# Altium schematic sheet Sata.SchDoc: NVMe
size A3; Organization: Altium Limited; Address1: L3, 12a Rodborough Rd; Address2: Frenchs Forest; Address3: NSW; Address4: Australia 2086
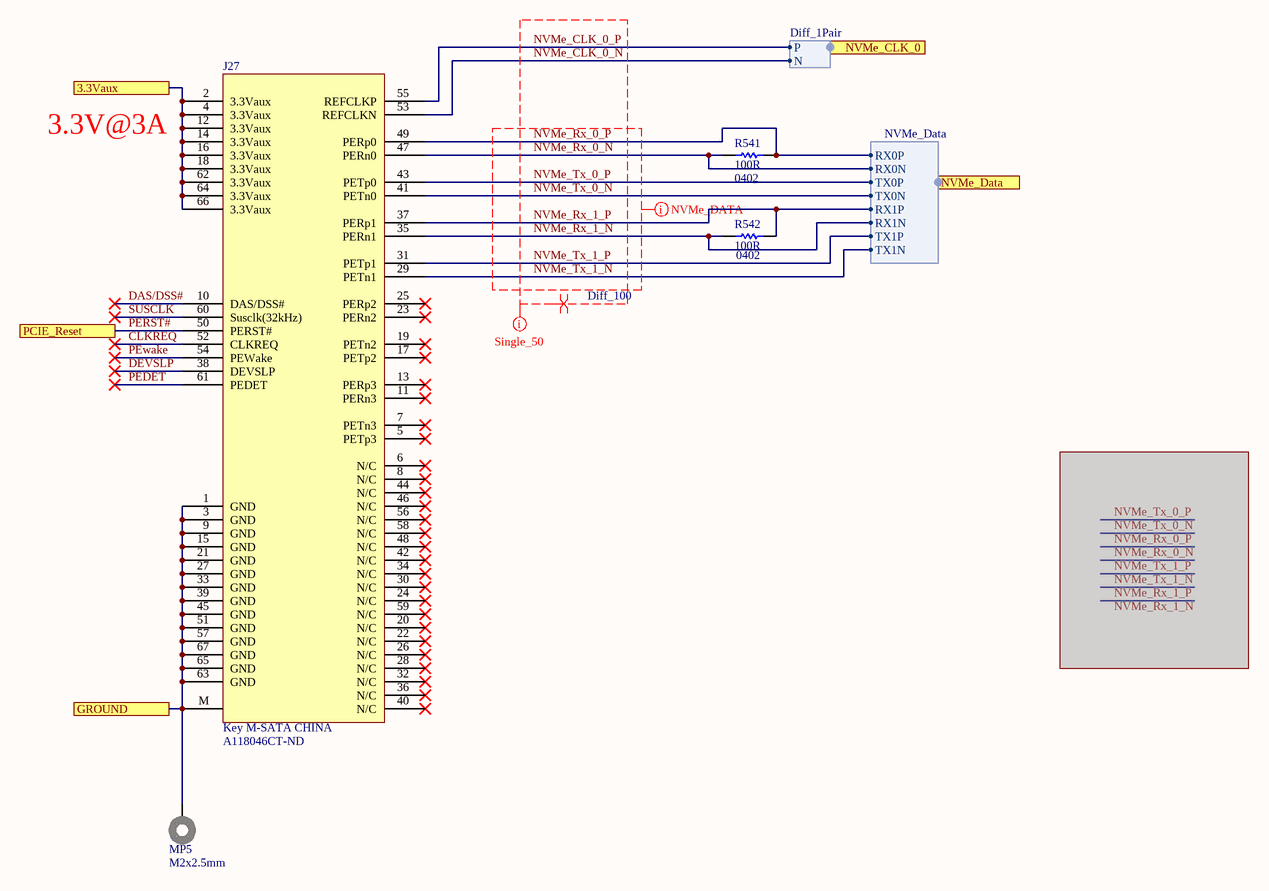
[diagram p0: Sata.SchDoc]

## Parts
J27  Key M-SATA CHINA  Supplier Part Number 1: A118046CT-ND  [M.2 KEY M - NVMe]
MP5  M2x2.5mm  [9774025243]
R541  100R  Case/Package: 0402  [RES 0402/1005 RF KK]
R542  100R  Case/Package: 0402  [RES 0402/1005 RF KK]

## Ports
3.3Vaux, GROUND, NVMe_CLK_0 (harness Diff_1Pair), NVMe_Data (harness NVMe_Data), PCIE_Reset

## Harnesses
Diff_1Pair: P, N
NVMe_Data: RX0P, RX0N, TX0P, TX0N, RX1P, RX1N, TX1P, TX1N

## Nets
3.3Vaux: J27.2(3.3Vaux) J27.4(3.3Vaux) J27.12(3.3Vaux) J27.14(3.3Vaux) J27.16(3.3Vaux) J27.18(3.3Vaux) J27.62(3.3Vaux) J27.64(3.3Vaux) J27.66(3.3Vaux) ; port 3.3Vaux
CLKREQ: J27.52(CLKREQ)
DAS/DSS#: J27.10(DAS/DSS#)
DEVSLP: J27.38(DEVSLP)
GROUND: J27.1(GND) J27.3(GND) J27.9(GND) J27.15(GND) J27.21(GND) J27.27(GND) J27.33(GND) J27.39(GND) J27.45(GND) J27.51(GND) J27.57(GND) J27.63(GND) J27.65(GND) J27.67(GND) J27.M MP5.1 ; port GROUND
NVMe_CLK_0_N: J27.53(REFCLKN) ; port NVMe_CLK_0.N
NVMe_CLK_0_P: J27.55(REFCLKP) ; port NVMe_CLK_0.P
NVMe_Rx_0_N: J27.47(PERn0) R541.2 ; port NVMe_Data.RX0N
NVMe_Rx_0_P: J27.49(PERp0) R541.1 ; port NVMe_Data.RX0P
NVMe_Rx_1_N: J27.35(PERn1) R542.1 ; port NVMe_Data.RX1N
NVMe_Rx_1_P: J27.37(PERp1) R542.2 ; port NVMe_Data.RX1P
NVMe_Tx_0_N: J27.41(PETn0) ; port NVMe_Data.TX0N
NVMe_Tx_0_P: J27.43(PETp0) ; port NVMe_Data.TX0P
NVMe_Tx_1_N: J27.29(PETn1) ; port NVMe_Data.TX1N
NVMe_Tx_1_P: J27.31(PETp1) ; port NVMe_Data.TX1P
PEDET: J27.61(PEDET)
PERST#: J27.50(PERST#) ; port PCIE_Reset
PEwake: J27.54(PEWake)
SUSCLK: J27.60(Susclk(32kHz))

Not connected (* = marked no-connect by the designer): J27 5(PETp3)* 6(N/C)* 7(PETn3)* 8(N/C)* 11(PERn3)* 13(PERp3)* 17(PETp2)* 19(PETn2)* 20(N/C)* 22(N/C)* 23(PERn2)* 24(N/C)* 25(PERp2)* 26(N/C)* 28(N/C)* 30(N/C)* 32(N/C)* 34(N/C)* 36(N/C)* 40(N/C)* 42(N/C)* 44(N/C)* 46(N/C)* 48(N/C)* 56(N/C)* 58(N/C)* 59(N/C)*

## Layout directives
net class NVMe_DATA: NVMe_Rx_0_N, NVMe_Rx_0_P, NVMe_Rx_1_N, NVMe_Rx_1_P, NVMe_Tx_0_N, NVMe_Tx_0_P, NVMe_Tx_1_N, NVMe_Tx_1_P
differential pair; differential pair class Diff_100: NVMe_CLK_0_N, NVMe_CLK_0_P, NVMe_Rx_0_N, NVMe_Rx_0_P, NVMe_Rx_1_N, NVMe_Rx_1_P, NVMe_Tx_0_N, NVMe_Tx_0_P, NVMe_Tx_1_N, NVMe_Tx_1_P
net class Single_50: NVMe_CLK_0_N, NVMe_CLK_0_P, NVMe_Rx_0_N, NVMe_Rx_0_P, NVMe_Rx_1_N, NVMe_Rx_1_P, NVMe_Tx_0_N, NVMe_Tx_0_P, NVMe_Tx_1_N, NVMe_Tx_1_P

## Notes on the sheet
- 3.3V@3A
- Title
- Size:
- Date:
- A3
- Number:
- Time:
- Revision:
- Sheet
- of
- File:

## Library data of the parts
J27 = 1-2199230-6_CHINA: CONN EDGE DUAL FMALE 67POS 0.020; Manufacturer 1: TE Connectivity; Number of Positions: 67; PCB Mounting Orientation: Right Angle; Contact Current Rating: 500mA; Pitch: 0.5mm; Supplier 1: Digi-Key; Manufacturer Part Number 1: 1-2199230-6; Stock 1: 3265; Pricing 1: 1=1,59000, 10=1,43900, 25=1,35120, 50=1,29220, 100=1,23350, 250=1,11608, 500=1,02796 (USD); RoHS: Yes; Mount: Surface Mount; Housing Color: Black; Contact Material: Copper Alloy; Contact Plating: Gold,Matte; Housing Material: Thermoplastic; Package Quantity: 1; Orientation: Right Angle; Packaging: Tape and Reel; Number of Rows: 2; Length: 0.862inch; Height: 0.165inch; Width: 8.7mm; ELV: Compliant; ComponentLink1URL: https://datasheet.ciiva.com/29349/eng-cd-2199230-b1-c-2199230-b1-29349141.pdf?src-supplier=Digi-Key; ComponentLink1Description: https://datasheet.ciiva.com/29349/eng-cd-2199230-b1-c-2199230-b1-29349141.pdf?src-supplier=Digi-Key
MP5 = 9774025243R: WA-SMSI SMT Steel Spacer, OD4.35mm, M2x2.5mm; Inner Diameter: 2.8mm; Outer Diameter: 4.35mm; Surface: Tin; Thread: M2; ComponentLink1Description: Manufacturer; ComponentLink1URL: http://www.we-online.de; ComponentLink2Description: Datasheet; ComponentLink2URL: https://katalog.we-online.com/em/datasheet/9774025243R.pdf; Mounting Technology: SMT; Packaging: Tape and Reel; Part Number: 9774025243R; Length: 2.5mm; Inner Thread Length: -; Operating Temperature: -55 to +150degC; Publisher: Wurth Elektronik; Published Date: September 2019; Material: Steel
R541 R542 = Resistor: RES SMD 100 OHM 1% 1/16W 0402; Manufacturer: Yageo; Manufacturer Part Number: RC0402FR-07100RL; Power Rating: 62.5mW; Voltage Rating: 50V; Temperature Coefficient: 100ppm/°C; Supplier 1: Digi-Key; Supplier Part Number 1: 311-100LRDKR-ND; RoHS: Yes; Category: Chip SMD Resistors; Stock 1: 42078262; Pricing 1: 1=0,10000, 10=0,01600, 100=0,00640, 1000=0,00289, 2500=0,00251, 5000=0,00207 (USD); Number of Pins: 2; Case Code (Imperial): 0402; Case Code (Metric): 1005; Min Operating Temperature: -55°C; Max Operating Temperature: 155°C; Tolerance: 1%; Resistance: 100R; Packaging: Tape and Reel; Termination: SMD/SMT; Composition: Thick Film; Military Standard: Not; Voltage Rating (DC): 50V; Length: 1mm; Height: 0.32mm; Depth: 0.5mm; Width: 0.5mm; REACH SVHC: No SVHC; Lead Free: Lead Free; ComponentLink1URL: https://datasheet.ciiva.com/7849/1784430-7849810.pdf?src-supplier=Element14; ComponentLink1Description: https://datasheet.ciiva.com/7849/1784430-7849810.pdf?src-supplier=Element14; ComponentLink2URL: https://datasheet.ciiva.com/11808/0900766b80c66297-11808765.pdf?src-supplier=RSComponents; ComponentLink2Description: https://datasheet.ciiva.com/11808/0900766b80c66297-11808765.pdf?src-supplier=RSComponents; ComponentLink3URL: https://datasheet.ciiva.com/12667/pyu-rc0402-51-rohs-l-6-r-12667957.pdf?src-supplier=Mouser; ComponentLink3Description: https://datasheet.ciiva.com/12667/pyu-rc0402-51-rohs-l-6-r-12667957.pdf?src-supplier=Mouser; ComponentLink4URL: https://datasheet.ciiva.com/16740/pyu-rc0402-51-rohs-l-6-r-16740566.pdf?src-supplier=Future+Electronics; ComponentLink4Description: https://datasheet.ciiva.com/16740/pyu-rc0402-51-rohs-l-6-r-16740566.pdf?src-supplier=Future+Electronics; ComponentLink5URL: https://datasheet.ciiva.com/15189/getdatasheetpartid-329466-15189335.pdf?src-supplier=Verical; ComponentLink5Description: https://datasheet.ciiva.com/15189/getdatasheetpartid-329466-15189335.pdf?src-supplier=Verical; ComponentLink6URL: https://datasheet.ciiva.com/28367/1018594-28367226.pdf?src-supplier=Element14; ComponentLink6Description: https://datasheet.ciiva.com/28367/1018594-28367226.pdf?src-supplier=Element14; ComponentLink7URL: https://datasheet.ciiva.com/22747/1018594-22747511.pdf?src-supplier=Element14; ComponentLink7Description: https://datasheet.ciiva.com/22747/1018594-22747511.pdf?src-supplier=Element14